# Altium project ASCII-v1.2.PrjPcb (part 2 of 3)

## Sheet Controller_Section.SchDoc
size 420 x 297 mm; SheetNumber: 4; SheetTotal: 4
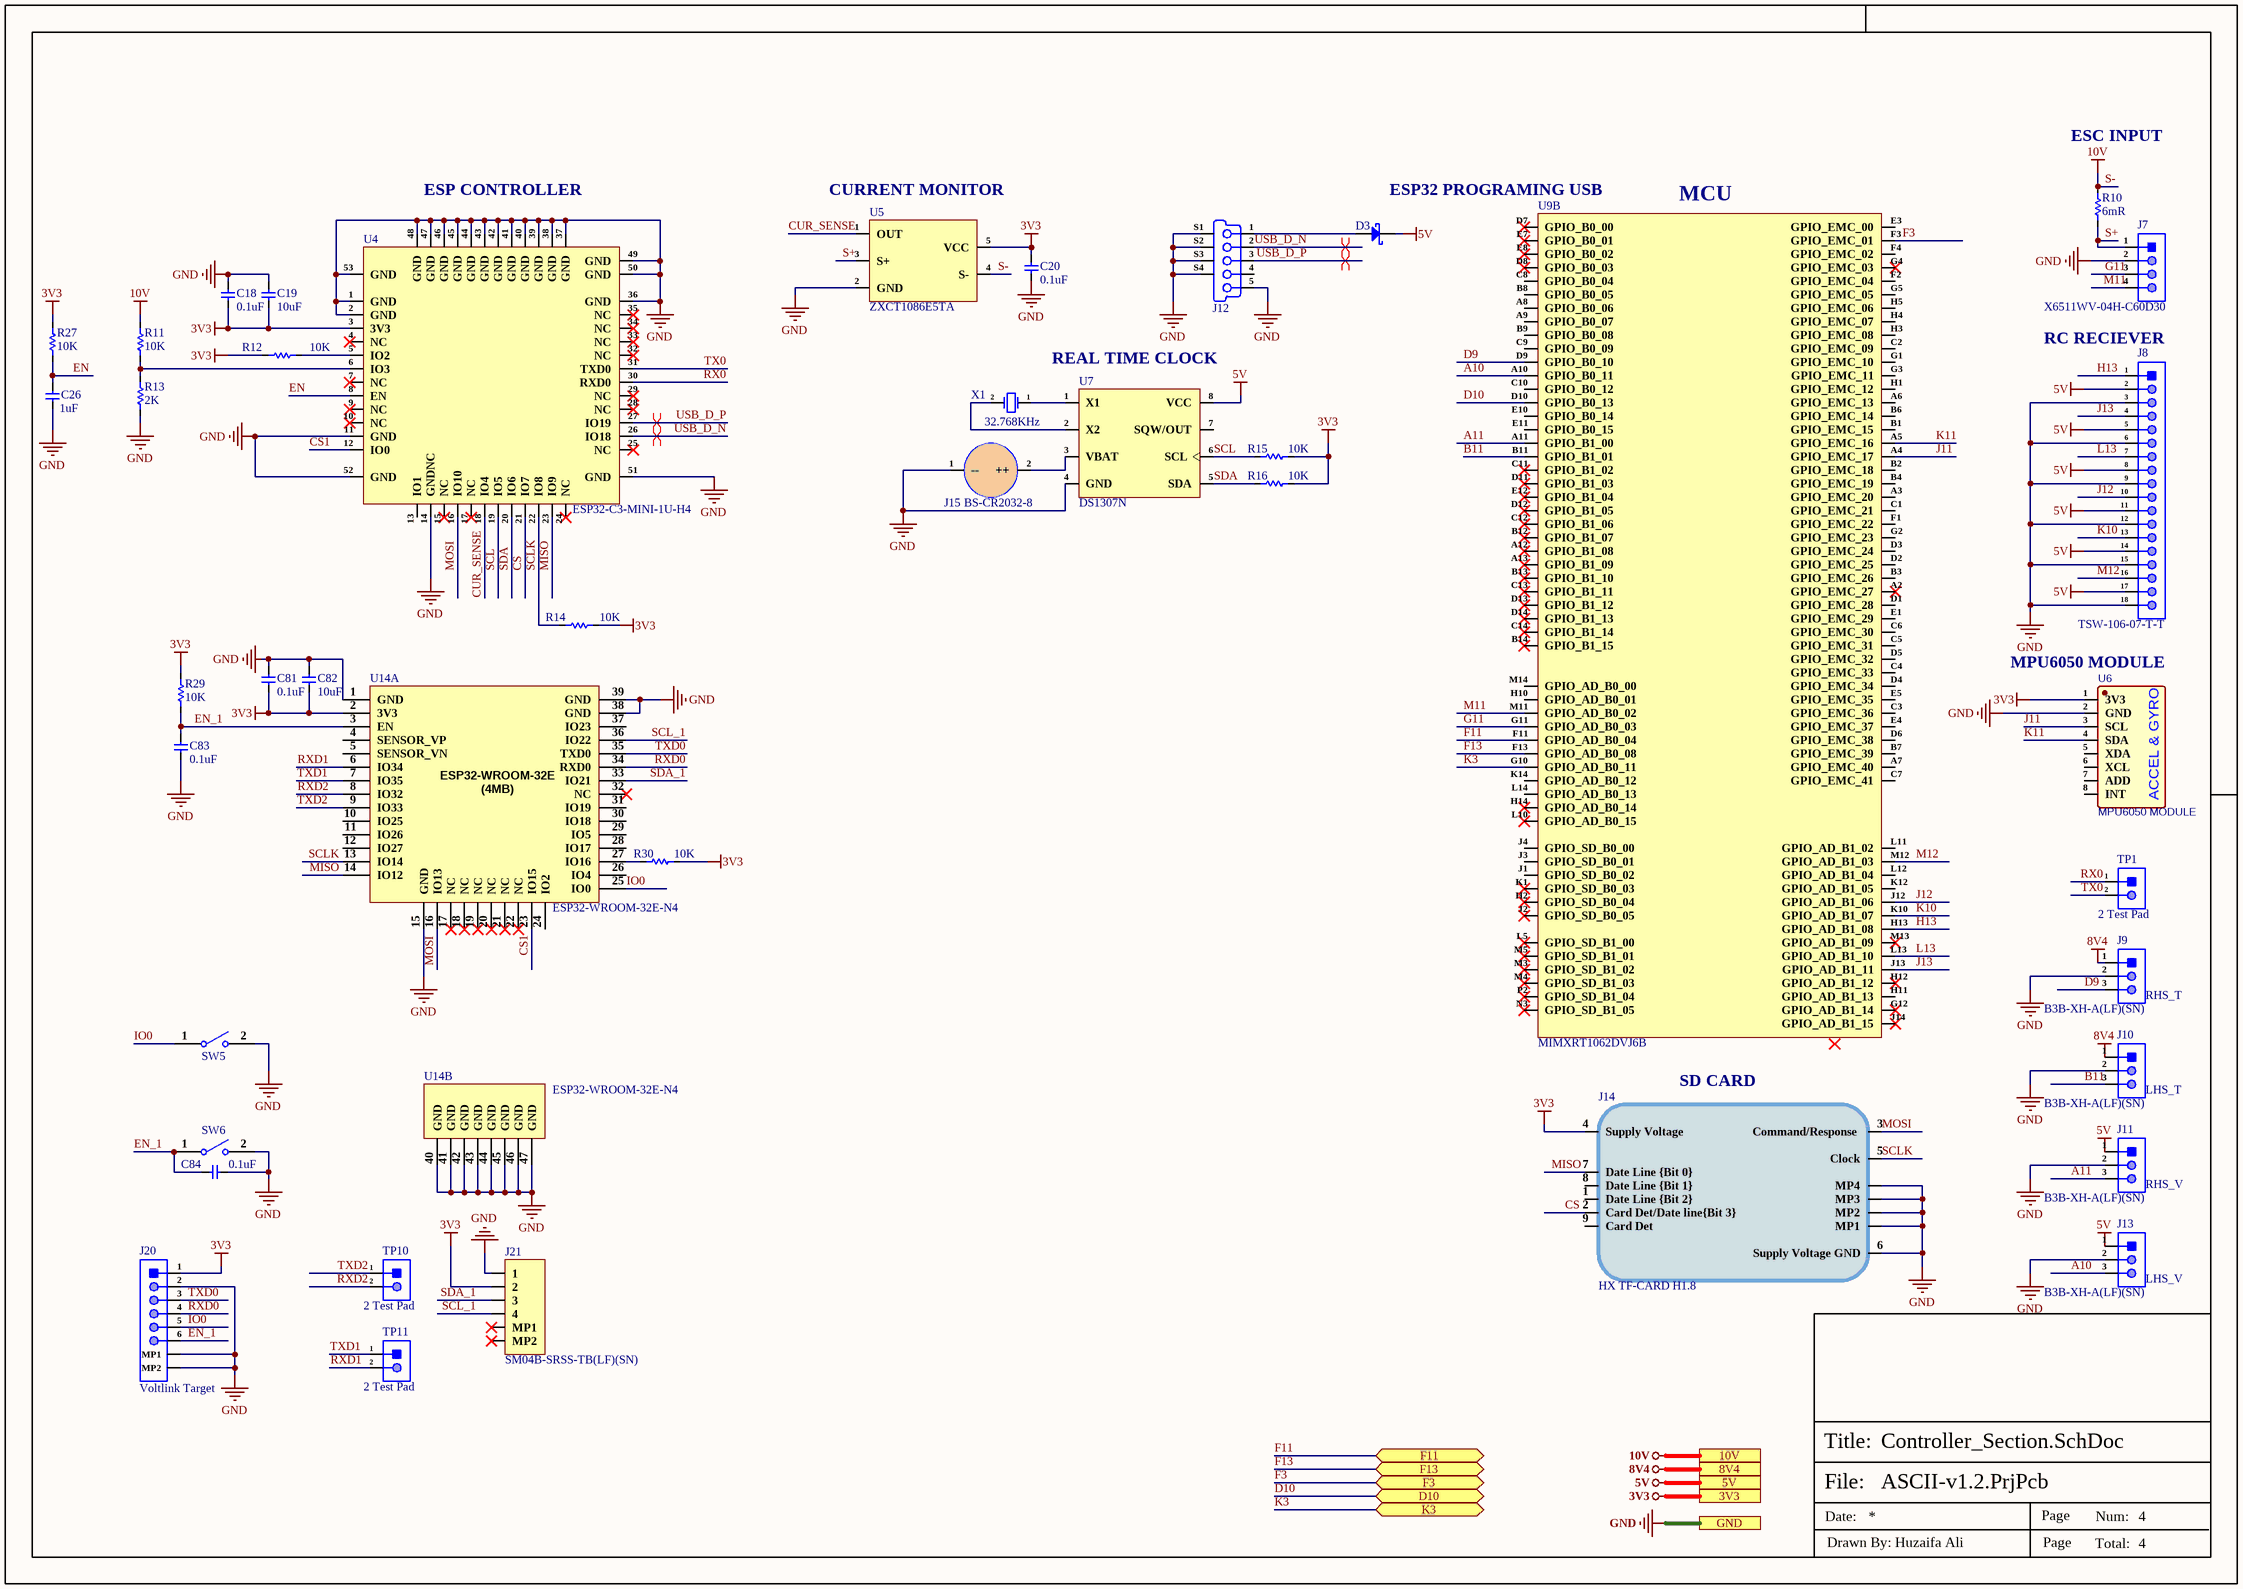
[diagram p2: Controller_Section.SchDoc]

### Parts
C18  0.1uF  [Cap-0402]
C19  10uF  [Cap-0603]
C20  0.1uF  [Cap-0402]
C26  1uF  [Cap-0402]
C81  0.1uF  [Cap-0402]
C82  10uF  [Cap-0603]
C83  0.1uF  [Cap-0402]
C84  0.1uF  [Cap-0402]
D3  SS34-MS  [SMA(DO-214AC)]  (value not drawn)
J7  X6511WV-04H-C60D30  [HDR1X4_]
J8  TSW-106-07-T-T  [TSW-106-07-T-T]
J9  B3B-XH-A(LF)(SN)  [B3B-XH-A(LF)(SN)_]
J10  B3B-XH-A(LF)(SN)  [B3B-XH-A(LF)(SN)_]
J11  B3B-XH-A(LF)(SN)  [B3B-XH-A(LF)(SN)_]
J12  HX MICRO XNJ JB  [HX MICRO XNJ JB]  (value not drawn)
J13  B3B-XH-A(LF)(SN)  [B3B-XH-A(LF)(SN)_]
J14  HX TF-CARD H1.8  [HX TF-CARD H1.8]
J15  BS-CR2032-8  [BS-CR2032-8]
J20  Voltlink Target  [Voltlink Target]
J21  SM04B-SRSS-TB(LF)(SN)  [SM04B-SRSS-TB(LF)(SN)]
R10  6mR  [RES-0805]
R11  10K  [Res-0402]
R12  10K  [Res-0402]
R13  2K  [Res-0402]
R14  10K  [Res-0402]
R15  10K  [Res-0402]
R16  10K  [Res-0402]
R27  10K  [Res-0402]
R29  10K  [Res-0402]
R30  10K  [Res-0402]
SW5  B3U-1000P  [B3U-1000P]  (value not drawn)
SW6  B3U-1000P  [B3U-1000P]  (value not drawn)
TP1  2 Test Pad  [2 Test Pad]  (no BOM)
TP10  2 Test Pad  [2 Test Pad]  (no BOM)
TP11  2 Test Pad  [2 Test Pad]  (no BOM)
U4  ESP32-C3-MINI-1U-H4  [ESP32-C3-MINI-1U-H4.]
U5  ZXCT1086E5TA  [SOT-23-5]
U6  MPU6050 MODULE  [MPU6050_]
U7  DS1307N  [8-PDIP]
U9  MIMXRT1062DVJ6B  [196-LFBGA (12x12)]  (part B of 2)
U14  ESP32-WROOM-32E-N4  [38-SMD Module]  (parts A,B of 2)
X1  32.768KHz  [DT-26]

### Ports
3V3 (see Top_Section[3B], Power_Section[1D], Teensy_4.1_Section[2D]), 5V (see Top_Section[3B], Power_Section[1D]), 8V4 (see Top_Section[3B], Power_Section[1D]), 10V (see Top_Section[3B], Power_Section[1D]), D10 (bidir, see Top_Section[3B], Teensy_4.1_Section[1D]), F3 (bidir, see Top_Section[3B], Teensy_4.1_Section[1D]), F11 (bidir, see Top_Section[3B], Teensy_4.1_Section[1D]), F13 (bidir, see Top_Section[3B], Teensy_4.1_Section[1D]), GND (see Top_Section[3B], Power_Section[1D], Teensy_4.1_Section[2D]), K3 (bidir, see Top_Section[3B], Teensy_4.1_Section[1D])

### Nets
3V3: C18.1 C19.1 C20.2 C81.1 C82.1 J14.4(Supply_Voltage) J20.1 J21.2 R12.1 R14.2 R15.2 R16.2 R27.1 R29.1 R30.1 U4.3(3V3) U5.5(VCC) U6.1(3V3) U14.2(3V3) ; port 3V3
5V: D3.1(K) J8.2 J8.5 J8.8 J8.11 J8.14 J8.17 J11.1 J13.1 U7.8(VCC) ; port 5V
8V4: J9.1 J10.1 ; port 8V4
GND: C18.2 C19.2 C20.1 C26.1 C81.2 C82.2 C83.1 C84.1 J7.2 J8.3 J8.6 J8.9 J8.12 J8.15 J8.18 J9.2 J10.2 J11.2 J12.5(GND) J12.S1(Shield) J12.S2(Shield) J12.S3(Shield) J12.S4(Shield) J13.2 J14.6(Supply_Voltage_GND) J14.MP1 J14.MP2 J14.MP3 J14.MP4 J15.1(--) J20.2 J20.MP1 J20.MP2 J21.1 R13.1 SW5.2 SW6.2 U4.1(GND) U4.2(GND) U4.11(GND) U4.14(GNDNC) U4.36(GND) U4.37(GND) U4.38(GND) U4.39(GND) U4.40(GND) U4.41(GND) U4.42(GND) U4.43(GND) U4.44(GND) U4.45(GND) U4.46(GND) U4.47(GND) U4.48(GND) U4.49(GND) U4.50(GND) U4.51(GND) U4.52(GND) U4.53(GND) U5.2(GND) U6.2(GND) U7.4(GND) U14.1(GND) U14.15(GND) U14.38(GND) U14.39(GND) U14.40(GND) U14.41(GND) U14.42(GND) U14.43(GND) U14.44(GND) U14.45(GND) U14.46(GND) U14.47(GND) ; port GND
S-: R10.1 R11.1 U5.4(S-) ; port 10V  [also labelled 10V]
A10: J13.3 U9.A10(GPIO_B0_11)
A11: J11.3 U9.A11(GPIO_B1_00)
B11: J10.3 U9.B11(GPIO_B1_01)
CS: J14.2(Card_Det/Date_line{Bit_3}) U4.21(IO7)
CS1: U4.12(IO0) U14.23(IO15)
CUR_SENSE: U4.18(IO4) U5.1(OUT)
D9: J9.3 U9.D9(GPIO_B0_10)
D10: U9.D10(GPIO_B0_13) ; port D10
EN: C26.2 R27.2 U4.8(EN)
EN_1: C83.2 C84.2 J20.6 R29.2 SW6.1 U14.3(EN)
F3: U9.F3(GPIO_EMC_01) ; port F3
F11: U9.F11(GPIO_AD_B0_04) ; port F11
F13: U9.F13(GPIO_AD_B0_08) ; port F13
G11: J7.3 U9.G11(GPIO_AD_B0_03)
H13: J8.1 U9.H13(GPIO_AD_B1_08)
IO0: J20.5 SW5.1 U14.25(IO0)
J11: U6.3(SCL) U9.A4(GPIO_EMC_17)
J12: J8.10 U9.J12(GPIO_AD_B1_06)
J13: J8.4 U9.J13(GPIO_AD_B1_11)
K3: U9.G10(GPIO_AD_B0_11) ; port K3
K10: J8.13 U9.K10(GPIO_AD_B1_07)
K11: U6.4(SDA) U9.A5(GPIO_EMC_16)
L13: J8.7 U9.L13(GPIO_AD_B1_10)
M11: J7.4 U9.M11(GPIO_AD_B0_02)
M12: J8.16 U9.M12(GPIO_AD_B1_03)
MISO: J14.7(Date_Line_{Bit_0}) U4.23(IO9) U14.14(IO12)
MOSI: J14.3(Command/Response) U4.16(IO10) U14.16(IO13)
RX0: TP1.1 U4.30(RXD0)
RXD0: J20.4 U14.34(RXD0)
RXD1: TP11.2 U14.6(IO34)
RXD2: TP10.2 U14.8(IO32)
S+: J7.1 R10.2 U5.3(S+)
SCL: R15.1 U4.19(IO5) U7.6(SCL)
SCL_1: J21.4 U14.36(IO22)
SCLK: J14.5(Clock) R14.1 U4.22(IO8) U14.13(IO14)
SDA: R16.1 U4.20(IO6) U7.5(SDA)
SDA_1: J21.3 U14.33(IO21)
TX0: TP1.2 U4.31(TXD0)
TXD0: J20.3 U14.35(TXD0)
TXD1: TP11.1 U14.7(IO35)
TXD2: TP10.1 U14.9(IO33)
USB_D_N: J12.2(D-) U4.26(IO18)
USB_D_P: J12.3(D+) U4.27(IO19)
NetD3_2: D3.2(A) J12.1(V_BUS_(5V))
NetJ15_2: J15.2(++) U7.3(VBAT)
NetR11_2: R11.2 R13.2 U4.6(IO3)
NetR12_2: R12.2 U4.5(IO2)
NetR30_2: R30.2 U14.27(IO16)
NetU7_1: U7.1(X1) X1.1(OSC1)
NetU7_2: U7.2(X2) X1.2(OSC2)

Not connected (* = marked no-connect by the designer): J12 4(ID); J14 1(Date_Line_{Bit_2}) 8(Date_Line_{Bit_1}) 9(Card_Det); J21 MP1* MP2*; U4 4(NC)* 7(NC)* 9(NC)* 10(NC)* 13(IO1) 15(NC)* 17(NC)* 24(NC)* 25(NC)* 28(NC)* 29(NC)* 32(NC)* 33(NC)* 34(NC)* 35(NC)*; U6 5(XDA) 6(XCL) 7(ADD) 8(INT); U7 7(SQW/OUT); U9 A2(GPIO_EMC_27)* A3(GPIO_EMC_20) A6(GPIO_EMC_13) A7(GPIO_EMC_40) A8(GPIO_B0_06) A9(GPIO_B0_07) A12(GPIO_B1_08)* A13(GPIO_B1_09)* B1(GPIO_EMC_15) B2(GPIO_EMC_18) B3(GPIO_EMC_26) B4(GPIO_EMC_19) B6(GPIO_EMC_14) B7(GPIO_EMC_39) B8(GPIO_B0_05) B9(GPIO_B0_08) B12(GPIO_B1_07)* B13(GPIO_B1_10)* B14(GPIO_B1_15)* C1(GPIO_EMC_21) C2(GPIO_EMC_09) C3(GPIO_EMC_36) C4(GPIO_EMC_33) C5(GPIO_EMC_31) C6(GPIO_EMC_30) C7(GPIO_EMC_41) C8(GPIO_B0_04) C9(GPIO_B0_09) C10(GPIO_B0_12) C11(GPIO_B1_02)* C12(GPIO_B1_06)* C13(GPIO_B1_11)* C14(GPIO_B1_14)* D1(GPIO_EMC_28) D2(GPIO_EMC_25) D3(GPIO_EMC_24) D4(GPIO_EMC_34) D5(GPIO_EMC_32) D6(GPIO_EMC_38) D7(GPIO_B0_00)* D8(GPIO_B0_03)* D11(GPIO_B1_03)* D12(GPIO_B1_05)* D13(GPIO_B1_12)* D14(GPIO_B1_13)* E1(GPIO_EMC_29) E3(GPIO_EMC_00) E4(GPIO_EMC_37) E5(GPIO_EMC_35) E7(GPIO_B0_01)* E8(GPIO_B0_02)* E10(GPIO_B0_14) E11(GPIO_B0_15) E12(GPIO_B1_04)* F1(GPIO_EMC_22) F2(GPIO_EMC_04) F4(GPIO_EMC_02) G1(GPIO_EMC_10) G2(GPIO_EMC_23) G3(GPIO_EMC_11) G4(GPIO_EMC_03)* G5(GPIO_EMC_05) G12(GPIO_AD_B1_14)* H1(GPIO_EMC_12) H2(GPIO_SD_B0_04)* H3(GPIO_EMC_08) H4(GPIO_EMC_07) H5(GPIO_EMC_06) H10(GPIO_AD_B0_01) H11(GPIO_AD_B1_13) H12(GPIO_AD_B1_12)* H14(GPIO_AD_B0_14)* J1(GPIO_SD_B0_02) J2(GPIO_SD_B0_05)* J3(GPIO_SD_B0_01) J4(GPIO_SD_B0_00) J14(GPIO_AD_B1_15)* K1(GPIO_SD_B0_03)* K12(GPIO_AD_B1_05) K14(GPIO_AD_B0_12) L5(GPIO_SD_B1_00)* L10(GPIO_AD_B0_15)* L11(GPIO_AD_B1_02) L12(GPIO_AD_B1_04) L14(GPIO_AD_B0_13) M3(GPIO_SD_B1_02)* M4(GPIO_SD_B1_03)* M5(GPIO_SD_B1_01)* M13(GPIO_AD_B1_09)* M14(GPIO_AD_B0_00) N3(GPIO_SD_B1_05)* P2(GPIO_SD_B1_04)*; U14 4(SENSOR_VP) 5(SENSOR_VN) 10(IO25) 11(IO26) 12(IO27) 17(NC)* 18(NC)* 19(NC)* 20(NC)* 21(NC)* 22(NC)* 24(IO2) 26(IO4) 28(IO17) 29(IO5) 30(IO18) 31(IO19) 32(NC)* 37(IO23)

### Layout directives
differential pair; net class USB_PROGRAM; differential pair class USB_PROGRAM_LINES; rule Impedance Constraint [Min = 85.00    Max = 90.00    ]; rule Matched Net Lengths [Tolerance = 50mil]: USB_D_N, USB_D_P

### Notes on the sheet
- (near U9) MCU
- (near R10) ESC INPUT
- (near U4) ESP CONTROLLER
- (near U5) CURRENT MONITOR
- ESP32 PROGRAMING USB
- REAL TIME CLOCK
- RC RECIEVER
- (near U6) MPU6050 MODULE
- (near J9) RHS_T
- SD CARD
- (near J10) LHS_T
- (near J11) RHS_V
- (near J13) LHS_V
- File:
- Title:
- Date:
- Page
- Num:
- Total:
- Drawn By: Huzaifa Ali
- (in symbol ESP32-WROOM-32E-N4, part A) ESP32-WROOM-32E (4MB) /
- (in symbol MPU6050 MODULE) ACCEL & GYRO

### Library data of the parts
C18 C20 C81 C83 C84 = CC0402KRX7R8BB104: CAP CER 0.1UF 25V X7R 0402; Manufacturer: Yageo; Tolerance: 10%; Capacitance: 100nF; Dissipation Factor: 3.5%; Supplier 1: Digi-Key; Manufacturer Part Number: CC0402KRX7R8BB104; RoHS: Yes; Category: Ceramic Capacitors; Stock 1: 1841009; Pricing 1: 1=0.10000, 10=0.03100, 50=0.01700, 100=0.01390, 500=0.00990, 1000=0.00777, 2500=0.00707, 5000=0.00650 (USD); Mount: Surface Mount; Case/Package: 0402; Case Code (Imperial): 0402; Case Code (Metric): 1005; Min Operating Temperature: -55°C; Max Operating Temperature: 125°C; Dielectric: X7R; Voltage Rating: 25V; Voltage Rating (DC): 25V; Packaging: Tape and Reel; Termination: SMD/SMT; Resistor Type: Ceramic; Length: 1mm; Width: 0.02inch; Height: 0.5mm; Thickness: 0.022inch; Depth: 0.5mm; Radiation Hardening: No; Lead Free: Lead Free; Halogen Free: Halogen Free; ComponentLink1URL: https://datasheet.ciiva.com/11464/upy-gphc-x7r-6-3v-to-50v-8-11464889.pdf?src-supplier=Avnet; ComponentLink1Description: https://datasheet.ciiva.com/11464/upy-gphc-x7r-6-3v-to-50v-8-11464889.pdf?src-supplier=Avnet; ComponentLink2URL: https://datasheet.ciiva.com/13210/upy-gphc-x7r-6-3v-to-50v-8-12304-13210908.pdf?src-supplier=Mouser; ComponentLink2Description: https://datasheet.ciiva.com/13210/upy-gphc-x7r-6-3v-to-50v-8-12304-13210908.pdf?src-supplier=Mouser; ComponentLink3URL: https://datasheet.ciiva.com/17437/upy-gphc-x7r-6-3v-to-50v-8-17437357.pdf?src-supplier=Avnet+Europe; ComponentLink3Description: https://datasheet.ciiva.com/17437/upy-gphc-x7r-6-3v-to-50v-8-17437357.pdf?src-supplier=Avnet+Europe; Supplier Part Number 1: 311-2077-1-ND; LCSC Part Number: C105883
C19 C82 = CL10A106MA8NRNC: CAP CER 10UF 25V X5R 0603; Manufacturer: Samsung; Tolerance: 20%; Supplier 1: Avnet; Manufacturer Part Number: CL10A106MA8NRNC; RoHS: Yes; Category: Ceramic Capacitors; Pricing 1: 4000=0.03753, 8000=0.03700, 16000=0.03595, 24000=0.03515, 32000=0.03383, 40000=0.03304, 400000=0.03225 (USD); Mount: Surface Mount; Case/Package: 0603; Case Code (Metric): 1608; Case Code (Imperial): 0603; Contact Plating: Tin; Min Operating Temperature: -55°C; Max Operating Temperature: 85°C; Package Quantity: 1; Packaging: Tape and Reel; Capacitance: 10uF; Voltage Rating: 25V; Dielectric: X5R; Termination: Wraparound; Series: CL; Construction: Flat; Length: 0.063inch; Width: 0.031inch; Thickness: 0.035inch; Lead Free: Lead Free; RoHS Compliant: Yes; ComponentLink1URL: https://datasheet.ciiva.com/25766/cl10a106ma8nrnc-25766562.pdf?src-supplier=Digi-Key; ComponentLink1Description: https://datasheet.ciiva.com/25766/cl10a106ma8nrnc-25766562.pdf?src-supplier=Digi-Key; Supplier Part Number 1: CL10A106MA8NRNC; LCSC Part Number: C96446
C26 = CC0402KRX5R7BB105: CAP CER 1UF 16V X5R 0402; Manufacturer: Yageo; Tolerance: 10%; Item Type: Capacitor; Supplier 1: Digi-Key; Manufacturer Part Number: CC0402KRX5R7BB105; Stock 1: 1405667; Pricing 1: 1=0.36, 10=0.252, 100=0.1512, 500=0.1134, 1000=0.09576, 2500=0.09072, 5000=0.08568 (USD); Mount: Surface Mount; Case/Package: 0402; Weight: 2.3E-05oz; Case Code (Imperial): 0402; Case Code (Metric): 1005; Min Operating Temperature: -55°C; Max Operating Temperature: 85°C; Capacitance: 1uF; Dielectric: X5R; Packaging: Tape and Reel; Voltage Rating (DC): 16V; Voltage Rating: 16V; Termination: SMD/SMT; Composition: Ceramic; Length: 1mm; Height: 0.5mm; Width: 0.02inch; Thickness: 0.022inch; Depth: 0.5mm; Radiation Hardening: No; Lead Free: Lead Free; Halogen Free: Halogen Free; ComponentLink1URL: http://www.yageo.com/documents/recent/UPY-GPHC_X5R_4V-to-50V_12.pdf?src-supplier=Avnet+Europe; ComponentLink1Description: http://www.yageo.com/documents/recent/UPY-GPHC_X5R_4V-to-50V_12.pdf?src-supplier=Avnet+Europe; Supplier Part Number 1: 311-1691-6-ND; LCSC Part Number: C325464
D3 = SS34-MS: 40V 3A 550mV@3A SMA(DO-214AC) Schottky Diodes ROHS; Manufacturer: MSKSEMI; Item Type: Diode; Manufacturer Part Number: SS34-MS; Package: SMA(DO-214AC); LCSC Part Number: C2836396; ComponentLink1Description: LCSC; ComponentLink1URL: https://www.lcsc.com/product-detail/Schottky-Diodes_MSKSEMI-SS34-MS_C2836396.html
J7 = X6511WV-04H-C60D30: Gold 250V 3A Straight Square Pins 2.5mm 4P 260℃ 6mm -40℃~+105℃ 3mm 2.54mm Plugin Black Brass 1x4P Plugin,P=2.54mm Pin Headers ROHS; Manufacturer: XKB; Item Type: Male Header; ComponentLink1Description: LCSC; ComponentLink1URL: https://www.lcsc.com/product-detail/Pin-Headers_XKB-Connectivity-X6511WV-04H-C60D30_C706876.html; Manufacturer Part Number: X6511WV-04H-C60D30; Package: Plugin,P=2.54mm; LCSC Part Number: C706876
J8 = TSW-106-07-T-T: CONN HEADER VERT 18POS 2.54MM; Manufacturer: Samtec; Item Type: Connectors; Supplier: Arrow Electronics; LCSC Part Number: C5967361; Manufacturer Part Number: TSW-106-07-T-T; RoHS: Yes; Stock: 1529; ComponentLink1URL: http://www.samtec.com/ftppub/pdf/htsw_th.pdf?src-supplier=Avnet; ComponentLink1Description: http://www.samtec.com/ftppub/pdf/htsw_th.pdf?src-supplier=Avnet; ComponentLink2URL: https://datasheet.octopart.com/TSW-106-07-T-T-Samtec-datasheet-97325576.pdf?src-supplier=Sager+Electronics; ComponentLink2Description: https://datasheet.octopart.com/TSW-106-07-T-T-Samtec-datasheet-97325576.pdf?src-supplier=Sager+Electronics
J9-J11 J13 = B3B-XH-A(LF)(SN): CONN HEADER VERT 3POS 2.5MM; Manufacturer: JST; Current Rating: 3A; Number of Positions: 3; Connector Type: Male Pin; Voltage Rating (AC): 250V; Contact Resistance: 20mR; Insulation Resistance: 1GR; Gender: Male; Wire/Cable Gauge: 22AWG; Item Type: JST Connector; Supplier 1: Farnell; Manufacturer Part Number: B3B-XH-A(LF)(SN); RoHS: Yes; Category: Headers and Wire Housings; Stock 1: 114254; Pricing 1: 100=0.09250, 500=0.07700, 1000=0.06470, 2500=0.06340, 5000=0.06210, 10000=0.06080 (GBP); Mount: Through Hole; Contact Plating: Tin,Lead,Copper; Contact Material: Brass; Color: Natural; Housing Color: White; Housing Material: Polyamide; Min Operating Temperature: -25°C; Max Operating Temperature: 85°C; Number of Rows: 1; Packaging: Bulk; Termination: Press-Fit; Max Current Rating: 3A; Voltage Rating: 250V; Fastening Type: Detent; Number of Contacts: 3; Max Voltage Rating (AC): 250V; Max Voltage Rating (DC): 250V; Orientation: Straight; Length: 9.9mm; Pitch: 2.5mm; Lead Pitch: 2.5mm; Depth: 5.75mm; Lead Free: Lead Free; REACH SVHC: No SVHC; ComponentLink1URL: https://datasheet.ciiva.com/26894/getdatasheetpartid-640434-26894454.pdf?src-supplier=Verical; ComponentLink1Description: https://datasheet.ciiva.com/26894/getdatasheetpartid-640434-26894454.pdf?src-supplier=Verical; ComponentLink2URL: https://datasheet.ciiva.com/11746/0900766b8082653f-11746520.pdf?src-supplier=RSComponents; ComponentLink2Description: https://datasheet.ciiva.com/11746/0900766b8082653f-11746520.pdf?src-supplier=RSComponents; ComponentLink3URL: https://datasheet.ciiva.com/26894/getdatasheetpartid-440399-26894778.pdf?src-supplier=Verical; ComponentLink3Description: https://datasheet.ciiva.com/26894/getdatasheetpartid-440399-26894778.pdf?src-supplier=Verical; Supplier Part Number 1: 1516277; LCSC Part Number: C144394
J12 = HX MICRO XNJ JB: Female Micro-B SMD USB Connectors ROHS; Manufacturer: HANXIA; Item Type: Micro-B Connector; Manufacturer Part Number: HX MICRO XNJ JB; Package: Custom; LCSC Part Number: C5160305; ComponentLink1Description: LCSC; ComponentLink1URL: https://www.lcsc.com/product-detail/USB-Connectors_hanxia-HX-MICRO-XNJ-JB_C5160305.html
J14 = HX TF-CARD H1.8: -40℃~+70℃ 1.8mm Gold Card Slot MicroSD card (TF card) Brass Alloy Self-bouncing SMD SD Card / Memory Card Connector ROHS; Manufacturer: hanxia; Card Connection Mode: Pluggable; Item Type: MicroSD; ComponentLink1Description: LCSC; ComponentLink1URL: https://www.lcsc.com/product-detail/SD-Card-Memory-Card-Connector_hanxia-HX-TF-CARD-H1-8_C19189036.html; Manufacturer Part Number: HX TF-CARD H1.8; LCSC Part Number: C19189036
J15 = BS-CR2032-8: Battery holder -40℃~+85℃ Gold Copper end CR2032 SMD Button And Strip Battery Connector ROHS; Manufacturer: Lian Xin Technology; Item Type: Cell Holder; Manufacturer Part Number: BS-CR2032-8; Package: SMD; LCSC Part Number: C7498149; ComponentLink1Description: LCSC; ComponentLink1URL: https://www.lcsc.com/product-detail/Button-And-Strip-Battery-Connector_Lian-Xin-Technology-BS-CR2032-8_C7498149.html
J20 = C145963: 1x6P SH 1 1mm 6 SMD,P=1mm Wire To Board / Wire To Wire Connector ROHS; Manufacturer: BOOMELE; Manufacturer Part Number: C145963; Package: SMD,P=1mm; LCSC Part Number: C145963; Item Type: Connector; ComponentLink1Description: LCSC; ComponentLink1URL: https://www.lcsc.com/product-detail/Wire-To-Board-Wire-To-Wire-Connector_BOOMELE-Boom-Precision-Elec-C145963_C145963.html
J21 = SM04B-SRSS-TB(LF)(SN): Connector Header, Side Entry, SR Series, 4 Position, 1.00mm, 50V, Surface Mount, Tin, Natural; Manufacturer: JST; Number of Contacts: 4NUMBER; Contact Resistance: 40mR; Max Current Rating: 1A; Number of Positions: 4; Pitch: 1mm; Supplier: Future Electronics; Supplier Part Number: 4517173; Manufacturer Part Number: SM04B-SRSS-TB(LF)(SN); RoHS: Yes; Category: Headers and Wire Housings; Stock: 27000; Pricing: 3000=0.285, 6000=0.275 (USD); Mounting Technology: Surface Mount; Contact Material: Copper Alloy; Contact Plating: Copper,Tin; Housing Color: Beige; Housing Material: Polyamide; Contact Shape: Square; Contact Finish - Mating: TIN; Insulation Material: Nylon; Insulation Color: Natural; Min Operating Temperature: -25°C; Max Operating Temperature: 85°C; Number of Rows: 1; Termination: Solder; Orientation: Right Angle; Voltage Rating: 50V; Packaging: Tape and Reel; Max Voltage Rating (AC): 50V; Max Voltage Rating (DC): 50V; Connector Type: Header; Fastening Type: Pull; Series: SR; Contact Type: Male Pin; Length: 6mm; Depth: 4.95mm; Flammability Rating: UL94 V-0; ComponentLink1URL: https://datasheet.ciiva.com/26894/getdatasheetpartid-640736-26894676.pdf?src-supplier=Verical; ComponentLink1Description: https://datasheet.ciiva.com/26894/getdatasheetpartid-640736-26894676.pdf?src-supplier=Verical; ComponentLink2URL: https://datasheet.ciiva.com/26894/getdatasheetpartid-499363-26894945.pdf?src-supplier=Verical; ComponentLink2Description: https://datasheet.ciiva.com/26894/getdatasheetpartid-499363-26894945.pdf?src-supplier=Verical; ComponentLink3URL: https://datasheet.ciiva.com/16487/jstsm04b-srss-tb-lf-sn-16487222.pdf?src-supplier=Future+Electronics; ComponentLink3Description: https://datasheet.ciiva.com/16487/jstsm04b-srss-tb-lf-sn-16487222.pdf?src-supplier=Future+Electronics; LCSC Part No: C160404; ComponentLink4Description: LCSC; ComponentLink4URL: https://www.lcsc.com/product-detail/Wire-To-Board-Connector_JST-SM04B-SRSS-TB-LF-SN_C160404.html
R10 = RLM10FTSMR006: 500mW 6mΩ ±50ppm/℃ ±1% 0805 Current Sense Resistors / Shunt Resistors ROHS; Manufacturer: TA-I Tech; Manufacturer Part Number: RLM10FTSMR006; Package: 0805; LCSC Part Number: C163092; Item Type: Resistor; ComponentLink1Description: LCSC; ComponentLink1URL: https://www.lcsc.com/product-detail/Current-Sense-Resistors-Shunt-Resistors_TA-I-Tech-RLM10FTSMR006_C163092.html
R11 R12 R14-R16 R27 R29 R30 = RT0402BRD0710KL: RES SMD 10K OHM 0.1% 1/16W 0402; Manufacturer: Yageo; Item Type: Resistor; Supplier: Future Electronics; Supplier Part Number: 1236728; Manufacturer Part Number: RT0402BRD0710KL; RoHS: Yes; Category: Chip SMD Resistors; Stock: 490000; Pricing: 10000=0.0218, 20000=0.0213, 30000=0.021, 50000=0.0206, 100000=0.0199 (USD); ComponentLink1URL: https://datasheet.ciiva.com/12836/pyu-rt-1-to-0-05-rohs-l-4-12836454.pdf?src-supplier=Mouser; ComponentLink1Description: https://datasheet.ciiva.com/12836/pyu-rt-1-to-0-05-rohs-l-4-12836454.pdf?src-supplier=Mouser; LCSC Part Number: C190095
R13 = RMC04022K1%N: 62.5mW ±1% 2kΩ 0402 Chip Resistor - Surface Mount ROHS; Manufacturer: TyoHM; Manufacturer Part Number: RMC04022K1%N; LCSC Part Number: C325372; Item Type: Resistor; Value: 2K; ComponentLink1Description: LCSC; ComponentLink1URL: https://www.lcsc.com/product-detail/Chip-Resistor-Surface-Mount_TyoHM-RMC04022K1-N_C325372.html
SW5 SW6 = B3U-1000P: SWITCH TACTILE SPST-NO 0.05A 12V; Manufacturer: Omron; Mechanical Life: 200000Cycles; Operating Force: 1.5N; Throw Configuration: SPST; Current Rating: 50mA; Contact Resistance: 100mR; Illumination Type: Non-Illuminated,Illuminated; Switch Travel: 0.15mm; Switch Function: Off-Mom; Actuator Type: Standard; Actuator Length: 0.4mm; Ratings: Dust Proof,IP40; ComponentLink1URL: http://www.farnell.com/datasheets/60838.pdf?src-supplier=Farnell; ComponentLink1Description: http://www.farnell.com/datasheets/60838.pdf?src-supplier=Farnell; ComponentLink2URL: http://www.farnell.com/datasheets/60838.pdf?src-supplier=Element14; ComponentLink2Description: http://www.farnell.com/datasheets/60838.pdf?src-supplier=Element14; ComponentLink3URL: https://omronfs.omron.com/en_US/ecb/products/pdf/en-b3u.pdf?src-supplier=Digi-Key; ComponentLink3Description: https://omronfs.omron.com/en_US/ecb/products/pdf/en-b3u.pdf?src-supplier=Digi-Key; ComponentLink4URL: http://www.omron.com/ecb/products/pdf/en-b3u.pdf?src-supplier=Digi-Key; ComponentLink4Description: http://www.omron.com/ecb/products/pdf/en-b3u.pdf?src-supplier=Digi-Key; ComponentLink5URL: https://www.distrelec.biz/Web/Downloads/he/et/B3U_eng_datasheet.pdf?mime=application%2Fpdf&src-supplier=Distrelec; ComponentLink5Description: https://www.distrelec.biz/Web/Downloads/he/et/B3U_eng_datasheet.pdf?mime=application%2Fpdf&src-supplier=Distrelec; ComponentLink6URL: http://www.onlinecomponents.com/productFiles/mf-OM/en-b3u.pdf?src-supplier=Onlinecomponents.com; ComponentLink6Description: http://www.onlinecomponents.com/productFiles/mf-OM/en-b3u.pdf?src-supplier=Onlinecomponents.com; Supplier 1: Digi-Key; Manufacturer Part Number: B3U-1000P; Stock 1: 116454; Pricing 1: 1=1, 10=0.961, 25=0.9064, 50=0.7976, 100=0.7251, 250=0.68888, 500=0.67074, 1000=0.52571 (USD); Mount: Surface Mount; Weight: 0.000776oz; Contact Material: Silver; Min Operating Temperature: -25°C; Max Operating Temperature: 70°C; Packaging: Tape and Reel; Voltage Rating (DC): 12V; Package Quantity: 1; Max Current Rating: 50mA; Termination: SMD/SMT; Orientation: Straight; Max Voltage Rating (DC): 12V; Electrical Life: 200000Cycles; Insulation Resistance: 100MR; Contact Current Rating: 50mA; Length: 4mm; Height: 1.2mm; Depth: 2.5mm; Width: 3mm; REACH SVHC: Unknown; Lead Free: Lead Free; ComponentLink7URL: https://www.verical.com/server-webapp/html/getDatasheet?partID=552554&src-supplier=Verical; ComponentLink7Description: https://www.verical.com/server-webapp/html/getDatasheet?partID=552554&src-supplier=Verical; ComponentLink8URL: http://www.farnell.com/datasheets/1685550.pdf?src-supplier=Element14; ComponentLink8Description: http://www.farnell.com/datasheets/1685550.pdf?src-supplier=Element14; ComponentLink9URL: http://www.farnell.com/datasheets/2610940.pdf?src-supplier=Farnell; ComponentLink9Description: http://www.farnell.com/datasheets/2610940.pdf?src-supplier=Farnell; ComponentLink10URL: https://www.alliedelec.com/m/d/4c8a9ef82804fc3c241a13c1e298fd73.pdf?src-supplier=Allied+Electronics; ComponentLink10Description: https://www.alliedelec.com/m/d/4c8a9ef82804fc3c241a13c1e298fd73.pdf?src-supplier=Allied+Electronics; Supplier Part Number 1: SW1020DKR-ND; LCSC Part Number: C231329; Item Type: Switch
TP1 TP10 TP11 = 2 Test Pad: Wire Connecting Pad; Item Type: Test Point; Manufacturer Part Number: 2 Test Pad
U4 = ESP32-C3-MINI-1U-H4: SMD,12.5x13.2mm WiFi Modules ROHS; Manufacturer: Espressif Systems; Item Type: IC; Manufacturer Part Number: ESP32-C3-MINI-1U-H4; LCSC Part Number: C3013922; Package: SMD,12.5x13.2mm
U5 = ZXCT1086E5TA: IC CURRENT MONITOR SOT25; Manufacturer: Diodes; Supplier: Future Electronics; LCSC Part Number: C154866; Manufacturer Part Number: ZXCT1086E5TA; RoHS: Yes; Item Type: IC; Stock: 9000; Pricing: 3000=0.69, 6000=0.665 (USD); ComponentLink1URL: https://datasheet.ciiva.com/1484/1383709-1484867.pdf?src-supplier=Element14; ComponentLink1Description: https://datasheet.ciiva.com/1484/1383709-1484867.pdf?src-supplier=Element14
U6 = MPU6050 MODULE: GY-521 6DOF 3 Axis Analog Gyro Sensor + 3 Axis Accelerometer Module; Contributor: jofenix; Manufacturer Part Number: MPU6050; Supplier: Aliexpress; spicePre: U; spiceSymbolName: MPU6050 MODULE
U7 = DS1307N: DIP-8 Real Time Clocks ROHS; Manufacturer: Maxim; Item Type: IC; Supplier: Mouser; LCSC Part Number: C434596; Manufacturer Part Number: DS1307N; RoHS: Yes; Stock: 754; Pricing: 1=6.11, 10=4.06, 50=4.06, 100=3.42, 1000=2.77, 10000=2.6 (USD); ComponentLink1URL: https://datasheet.ciiva.com/19457/1194695-19457341.pdf?src-supplier=Jameco; ComponentLink1Description: https://datasheet.ciiva.com/19457/1194695-19457341.pdf?src-supplier=Jameco; ComponentLink2URL: https://datasheet.ciiva.com/30480/0900766b81253c0a-30480875.pdf?src-supplier=Rs; ComponentLink2Description: https://datasheet.ciiva.com/30480/0900766b81253c0a-30480875.pdf?src-supplier=Rs; ComponentLink3URL: https://datasheet.ciiva.com/1240/ds1307-1240473.pdf?src-supplier=Digikey; ComponentLink3Description: https://datasheet.ciiva.com/1240/ds1307-1240473.pdf?src-supplier=Digikey; ComponentLink4URL: https://datasheet.ciiva.com/3304/ds1307-3304456.pdf?src-supplier=Avnet; ComponentLink4Description: https://datasheet.ciiva.com/3304/ds1307-3304456.pdf?src-supplier=Avnet
U9 = MIMXRT1062DVJ6B: IC MCU 32BIT EXT MEM 196LFBGA; Manufacturer: NXP Semiconductors; Supplier: Digi-Key; Supplier Part Number: 568-MIMXRT1062DVJ6B-ND; Manufacturer Part Number: MIMXRT1062DVJ6B; RoHS: Yes; Category: Uncategorized; Stock: 1142; Pricing: 1=15.93, 10=12.734, 189=10.75497, 567=10.68896, 945=10.09187 (USD)
U14 = ESP32-WROOM-32E-N4: RX TXRX MOD WIFI TRACE ANT SMD; Manufacturer: Espressif Systems; Supplier 1: Digi-Key; Manufacturer Part Number: ESP32-WROOM-32E-N4; RoHS: No; Pricing 1: 1=3.00000 (USD); Supplier Part Number 1: 1965-ESP32-WROOM-32E(4MB)CT-ND
X1 = DT-26 32.768KHz: DT-26 Crystals ROHS; Manufacturer: KDS Daishinku; Manufacturer Part Number: DT-26 32.768KHz; Package: DT-26; LCSC Part Number: C93229; Item Type: Crystal; ComponentLink1Description: LCSC; ComponentLink1URL: https://www.lcsc.com/product-detail/Crystals_KDS-Daishinku-DT-26-32-768KHz_C93229.html